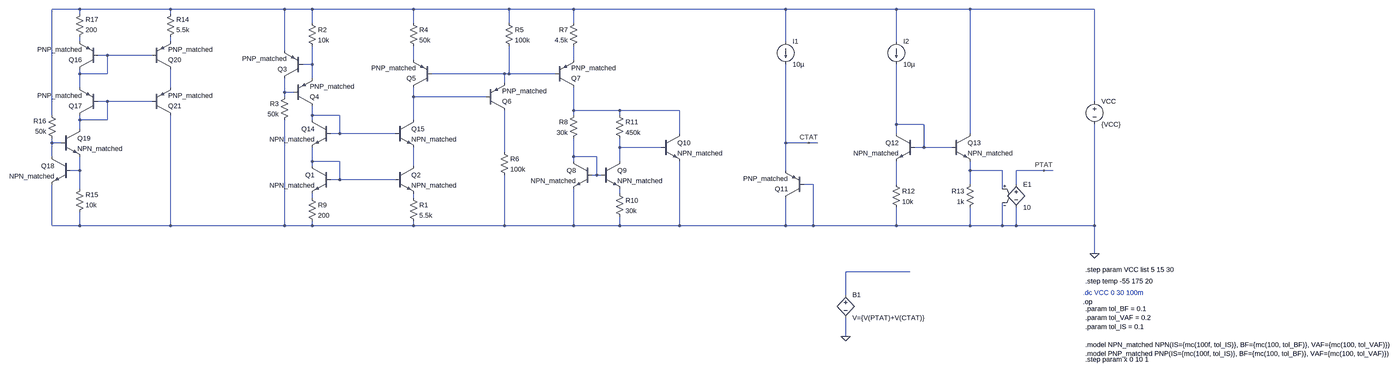
[diagram p0: schematic Widlar_Current_Source_with_Tolerances.asc, whole sheet]
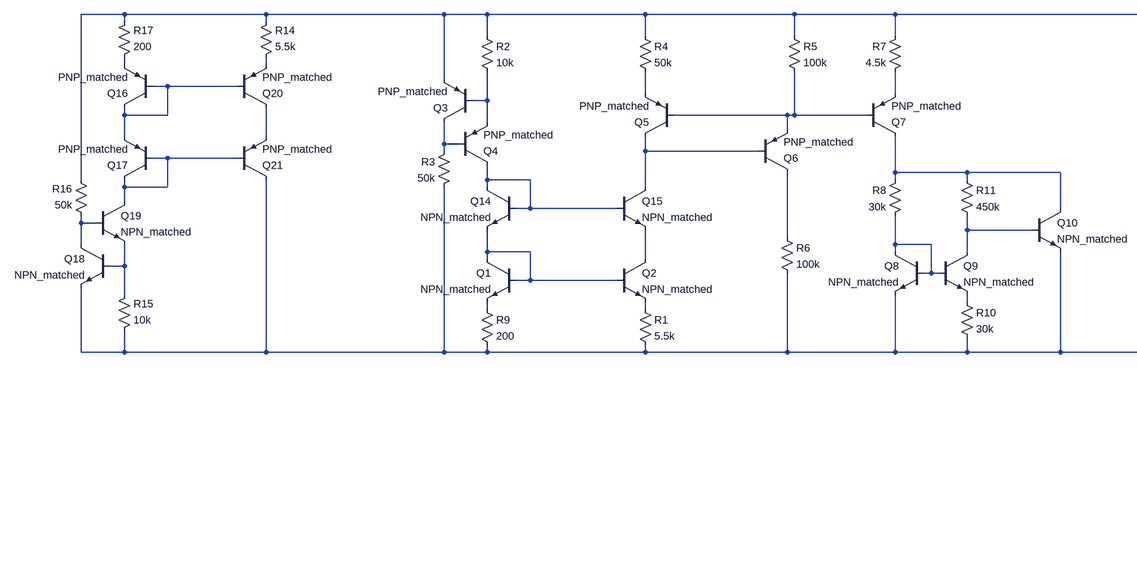
[diagram p1: schematic Widlar_Current_Source_with_Tolerances.asc, part, row 1 of 1, column 1 of 2]
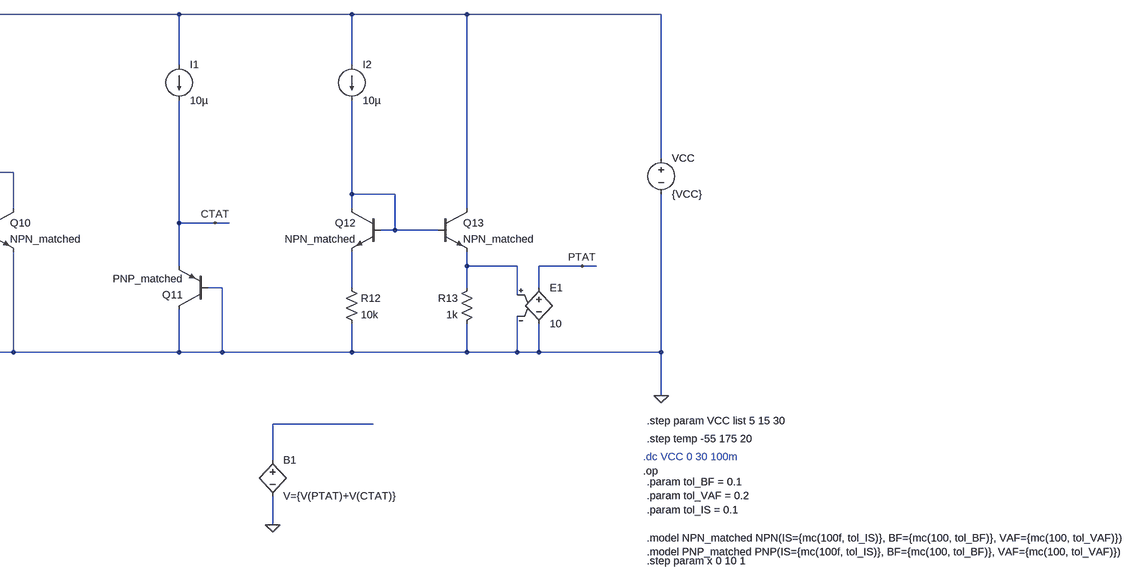
[diagram p2: schematic Widlar_Current_Source_with_Tolerances.asc, part, row 1 of 1, column 2 of 2]
Widlar_Current_Source_with_Tolerances.asc, the LTspice schematic file:
Version 4.1
SHEET 1 3692 1024
WIRE -1120 -352 -1216 -352
WIRE -768 -352 -1120 -352
WIRE -304 -352 -768 -352
WIRE -208 -352 -304 -352
WIRE 144 -352 -208 -352
WIRE 512 -352 144 -352
WIRE 736 -352 512 -352
WIRE 1472 -352 736 -352
WIRE 1856 -352 1472 -352
WIRE 2112 -352 1856 -352
WIRE 2544 -352 2112 -352
WIRE -1120 -336 -1120 -352
WIRE -768 -336 -768 -352
WIRE -208 -304 -208 -352
WIRE 144 -304 144 -352
WIRE 512 -304 512 -352
WIRE 736 -304 736 -352
WIRE -1120 -240 -1120 -256
WIRE -768 -240 -768 -256
WIRE 1472 -240 1472 -352
WIRE 1856 -240 1856 -352
WIRE -304 -208 -304 -352
WIRE -1024 -192 -1056 -192
WIRE -832 -192 -1024 -192
WIRE 144 -176 144 -224
WIRE 736 -176 736 -224
WIRE -208 -160 -208 -224
WIRE -208 -160 -240 -160
WIRE -1120 -128 -1120 -144
WIRE -1024 -128 -1024 -192
WIRE -1024 -128 -1120 -128
WIRE 496 -128 208 -128
WIRE 512 -128 512 -224
WIRE 512 -128 496 -128
WIRE 672 -128 512 -128
WIRE -208 -112 -208 -160
WIRE 496 -96 496 -128
WIRE -1120 -80 -1120 -128
WIRE -768 -80 -768 -144
WIRE -304 -64 -304 -112
WIRE -272 -64 -304 -64
WIRE -304 -48 -304 -64
WIRE 144 -48 144 -80
WIRE 432 -48 144 -48
WIRE -1024 -32 -1056 -32
WIRE -832 -32 -1024 -32
WIRE 2544 -32 2544 -352
WIRE 736 0 736 -80
WIRE 896 0 736 0
WIRE 1104 0 896 0
WIRE -1216 16 -1216 -352
WIRE -208 16 -208 -16
WIRE -112 16 -208 16
WIRE 736 16 736 0
WIRE 896 16 896 0
WIRE -1120 32 -1120 16
WIRE -1024 32 -1024 -32
WIRE -1024 32 -1120 32
WIRE -208 32 -208 16
WIRE 144 32 144 -48
WIRE 1856 48 1856 -160
WIRE 1952 48 1856 48
WIRE -1120 64 -1120 32
WIRE -112 80 -112 16
WIRE -112 80 -144 80
WIRE 80 80 -112 80
WIRE 1104 80 1104 0
WIRE 1856 80 1856 48
WIRE 2112 80 2112 -352
WIRE -1216 112 -1216 96
WIRE -1184 112 -1216 112
WIRE 1472 112 1472 -160
WIRE 1552 112 1472 112
WIRE 1584 112 1552 112
WIRE 896 128 896 96
WIRE 1040 128 896 128
WIRE 1952 128 1952 48
WIRE 1952 128 1920 128
WIRE 2048 128 1952 128
WIRE 496 144 496 0
WIRE -1216 160 -1216 112
WIRE 736 160 736 96
WIRE 816 160 736 160
WIRE -208 176 -208 128
WIRE -112 176 -208 176
WIRE 736 176 736 160
WIRE 896 176 896 128
WIRE -208 192 -208 176
WIRE 144 192 144 128
WIRE -1120 208 -1120 160
WIRE -1120 208 -1152 208
WIRE 1472 208 1472 112
WIRE 2112 208 2112 176
WIRE 2224 208 2112 208
WIRE 2368 208 2272 208
WIRE 2400 208 2368 208
WIRE 816 224 816 160
WIRE 816 224 800 224
WIRE 832 224 816 224
WIRE -112 240 -112 176
WIRE -112 240 -144 240
WIRE 80 240 -112 240
WIRE 1568 256 1536 256
WIRE 1856 256 1856 176
WIRE 2112 256 2112 208
WIRE 2272 256 2272 208
WIRE -1120 272 -1120 208
WIRE 2224 272 2224 208
WIRE 896 288 896 272
WIRE -208 304 -208 288
WIRE 144 304 144 288
WIRE -1216 400 -1216 256
WIRE -1120 400 -1120 352
WIRE -1120 400 -1216 400
WIRE -768 400 -768 16
WIRE -768 400 -1120 400
WIRE -304 400 -304 32
WIRE -304 400 -768 400
WIRE -208 400 -208 384
WIRE -208 400 -304 400
WIRE 144 400 144 384
WIRE 144 400 -208 400
WIRE 496 400 496 224
WIRE 496 400 144 400
WIRE 736 400 736 272
WIRE 736 400 496 400
WIRE 896 400 896 368
WIRE 896 400 736 400
WIRE 1104 400 1104 176
WIRE 1104 400 896 400
WIRE 1472 400 1472 304
WIRE 1472 400 1104 400
WIRE 1568 400 1568 256
WIRE 1568 400 1472 400
WIRE 1856 400 1856 336
WIRE 1856 400 1568 400
WIRE 2112 400 2112 336
WIRE 2112 400 1856 400
WIRE 2224 400 2224 320
WIRE 2224 400 2112 400
WIRE 2272 400 2272 336
WIRE 2272 400 2224 400
WIRE 2544 400 2544 48
WIRE 2544 400 2272 400
WIRE 2544 496 2544 400
WIRE 1904 560 1680 560
WIRE 1680 640 1680 560
WIRE 1680 784 1680 720
FLAG 2544 496 0
FLAG 1552 112 CTAT
FLAG 2368 208 PTAT
FLAG 1680 784 0
SYMBOL npn -144 192 M0
SYMATTR InstName Q1
SYMATTR Value NPN_matched
SYMBOL npn 80 192 R0
SYMATTR InstName Q2
SYMATTR Value NPN_matched
SYMBOL voltage 2544 -48 R0
WINDOW 123 0 0 Left 0
WINDOW 39 0 0 Left 0
SYMATTR InstName VCC
SYMATTR Value {VCC}
SYMBOL res 128 288 R0
SYMATTR InstName R1
SYMATTR Value 5.5k
SYMBOL res -224 -320 R0
SYMATTR InstName R2
SYMATTR Value 10k
SYMBOL pnp -240 -112 R180
SYMATTR InstName Q3
SYMATTR Value PNP_matched
SYMBOL pnp -272 -16 M180
SYMATTR InstName Q4
SYMATTR Value PNP_matched
SYMBOL res -288 -64 M0
SYMATTR InstName R3
SYMATTR Value 50k
SYMBOL res -224 288 R0
SYMATTR InstName R9
SYMATTR Value 200
SYMBOL res 128 -320 R0
SYMATTR InstName R4
SYMATTR Value 50k
SYMBOL pnp 208 -80 R180
SYMATTR InstName Q5
SYMATTR Value PNP_matched
SYMBOL pnp 432 0 M180
SYMATTR InstName Q6
SYMATTR Value PNP_matched
SYMBOL res 496 -320 R0
SYMATTR InstName R5
SYMATTR Value 100k
SYMBOL res 480 128 R0
SYMATTR InstName R6
SYMATTR Value 100k
SYMBOL res 752 -320 M0
SYMATTR InstName R7
SYMATTR Value 4.5k
SYMBOL pnp 672 -80 M180
SYMATTR InstName Q7
SYMATTR Value PNP_matched
SYMBOL npn 800 176 M0
SYMATTR InstName Q8
SYMATTR Value NPN_matched
SYMBOL res 752 0 M0
SYMATTR InstName R8
SYMATTR Value 30k
SYMBOL npn 832 176 R0
SYMATTR InstName Q9
SYMATTR Value NPN_matched
SYMBOL res 880 272 R0
SYMATTR InstName R10
SYMATTR Value 30k
SYMBOL res 880 0 R0
SYMATTR InstName R11
SYMATTR Value 450k
SYMBOL npn 1040 80 R0
SYMATTR InstName Q10
SYMATTR Value NPN_matched
SYMBOL current 1472 -240 R0
WINDOW 123 0 0 Left 0
WINDOW 39 0 0 Left 0
SYMATTR InstName I1
SYMATTR Value 10µ
SYMBOL pnp 1536 304 R180
SYMATTR InstName Q11
SYMATTR Value PNP_matched
SYMBOL current 1856 -240 R0
WINDOW 123 0 0 Left 0
WINDOW 39 0 0 Left 0
SYMATTR InstName I2
SYMATTR Value 10µ
SYMBOL npn 1920 80 M0
SYMATTR InstName Q12
SYMATTR Value NPN_matched
SYMBOL npn 2048 80 R0
SYMATTR InstName Q13
SYMATTR Value NPN_matched
SYMBOL res 1840 240 R0
SYMATTR InstName R12
SYMATTR Value 10k
SYMBOL res 2128 240 M0
SYMATTR InstName R13
SYMATTR Value 1k
SYMBOL e 2272 240 R0
SYMATTR InstName E1
SYMATTR Value 10
SYMBOL bv 1680 624 R0
SYMATTR InstName B1
SYMATTR Value V={V(PTAT)+V(CTAT)}
SYMBOL npn -144 32 M0
SYMATTR InstName Q14
SYMATTR Value NPN_matched
SYMBOL npn 80 32 R0
SYMATTR InstName Q15
SYMATTR Value NPN_matched
SYMBOL res -784 -240 M180
WINDOW 0 36 76 Left 2
WINDOW 3 36 40 Left 2
SYMATTR InstName R14
SYMATTR Value 5.5k
SYMBOL res -1136 368 M180
WINDOW 0 36 76 Left 2
WINDOW 3 36 40 Left 2
SYMATTR InstName R15
SYMATTR Value 10k
SYMBOL res -1200 112 R180
WINDOW 0 36 76 Left 2
WINDOW 3 36 40 Left 2
SYMATTR InstName R16
SYMATTR Value 50k
SYMBOL res -1136 -240 M180
WINDOW 0 36 76 Left 2
WINDOW 3 36 40 Left 2
SYMATTR InstName R17
SYMATTR Value 200
SYMBOL npn -1152 160 M0
SYMATTR InstName Q18
SYMATTR Value NPN_matched
SYMBOL npn -1184 64 R0
SYMATTR InstName Q19
SYMATTR Value NPN_matched
SYMBOL pnp -1056 -144 R180
SYMATTR InstName Q16
SYMATTR Value PNP_matched
SYMBOL pnp -1056 16 R180
SYMATTR InstName Q17
SYMATTR Value PNP_matched
SYMBOL pnp -832 -144 M180
SYMATTR InstName Q20
SYMATTR Value PNP_matched
SYMBOL pnp -832 16 M180
SYMATTR InstName Q21
SYMATTR Value PNP_matched
TEXT 2504 632 Left 2 ;.dc VCC 0 30 100m
TEXT 2512 592 Left 2 !.step temp -55 175 20
TEXT 2512 688 Left 2 !.param tol_BF = 0.1\n.param tol_VAF = 0.2\n.param tol_IS = 0.1\n \n.model NPN_matched NPN(IS={mc(100f, tol_IS)}, BF={mc(100, tol_BF)}, VAF={mc(100, tol_VAF)})\n.model PNP_matched PNP(IS={mc(100f, tol_IS)}, BF={mc(100, tol_BF)}, VAF={mc(100, tol_VAF)})
TEXT 2512 864 Left 2 !.step param x 0 10 1
TEXT 2504 664 Left 2 !.op
TEXT 2512 552 Left 2 !.step param VCC list 5 15 30

The netlist it stands for:
* Widlar_Current_Source_with_Tolerances.asc
Q1 N020 N020 N026 0 NPN_matched
Q2 N021 N020 N027 0 NPN_matched
VCC N001 0 {VCC}
R1 N027 0 5.5k
R2 N001 N007 10k
Q3 N010 N007 N001 0 PNP_matched
Q4 N014 N010 N007 0 PNP_matched
R3 N010 0 50k
R9 N026 0 200
R4 N001 N005 50k
Q5 N011 N008 N005 0 PNP_matched
Q6 N018 N011 N008 0 PNP_matched
R5 N001 N008 100k
R6 N018 0 100k
R7 N001 N006 4.5k
Q7 N013 N008 N006 0 PNP_matched
Q8 N019 N019 0 0 NPN_matched
R8 N013 N019 30k
Q9 N017 N019 N025 0 NPN_matched
R10 N025 0 30k
R11 N013 N017 450k
Q10 N013 N017 0 0 NPN_matched
I1 N001 CTAT 10µ
Q11 0 0 CTAT 0 PNP_matched
I2 N001 N015 10µ
Q12 N015 N015 N024 0 NPN_matched
Q13 N001 N015 N023 0 NPN_matched
R12 N024 0 10k
R13 N023 0 1k
E1 PTAT 0 N023 0 10
B1 N028 0 V={V(PTAT)+V(CTAT)}
Q14 N014 N014 N020 0 NPN_matched
Q15 N011 N014 N021 0 NPN_matched
R14 N003 N001 5.5k
R15 0 N022 10k
R16 N016 N001 50k
R17 N002 N001 200
Q18 N016 N022 0 0 NPN_matched
Q19 N012 N016 N022 0 NPN_matched
Q16 N004 N004 N002 0 PNP_matched
Q17 N012 N012 N004 0 PNP_matched
Q20 N009 N004 N003 0 PNP_matched
Q21 0 N012 N009 0 PNP_matched
.model NPN NPN
.model PNP PNP
.lib standard.bjt
* .dc VCC 0 30 100m
.step temp -55 175 20
.param tol_BF = 0.1
.param tol_VAF = 0.2
.param tol_IS = 0.1
.model NPN_matched NPN(IS={mc(100f, tol_IS)}, BF={mc(100, tol_BF)}, VAF={mc(100, tol_VAF)})
.model PNP_matched PNP(IS={mc(100f, tol_IS)}, BF={mc(100, tol_BF)}, VAF={mc(100, tol_VAF)})
.step param x 0 10 1
.op
.step param VCC list 5 15 30
.backanno
.end